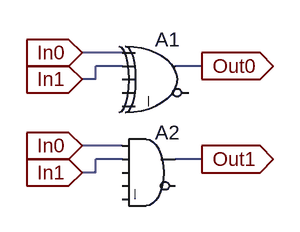
[diagram p0: schematic half-adder.asc]
half-adder.asc, the LTspice schematic file:
Version 4.1
SHEET 1 880 680
WIRE 144 112 96 112
WIRE 144 128 112 128
WIRE 240 128 208 128
WIRE 112 144 112 128
WIRE 112 144 96 144
WIRE 144 224 96 224
WIRE 144 240 112 240
WIRE 240 240 208 240
WIRE 112 256 112 240
WIRE 112 256 96 256
FLAG 96 112 In0
IOPIN 96 112 In
FLAG 96 144 In1
IOPIN 96 144 In
FLAG 240 128 Out0
IOPIN 240 128 Out
FLAG 96 224 In0
IOPIN 96 224 In
FLAG 96 256 In1
IOPIN 96 256 In
FLAG 240 240 Out1
IOPIN 240 240 Out
SYMBOL Digital\\xor 192 80 R0
SYMATTR InstName A1
SYMBOL Digital\\and 176 192 R0
SYMATTR InstName A2

The netlist it stands for:
* half-adder.asc
A1 In0 In1 0 0 0 0 Out0 0 XOR
A2 In0 In1 0 0 0 0 Out1 0 AND
.backanno
.end